# Altium project nexnclock_one_mainboard_rev_2_0.PrjPcb
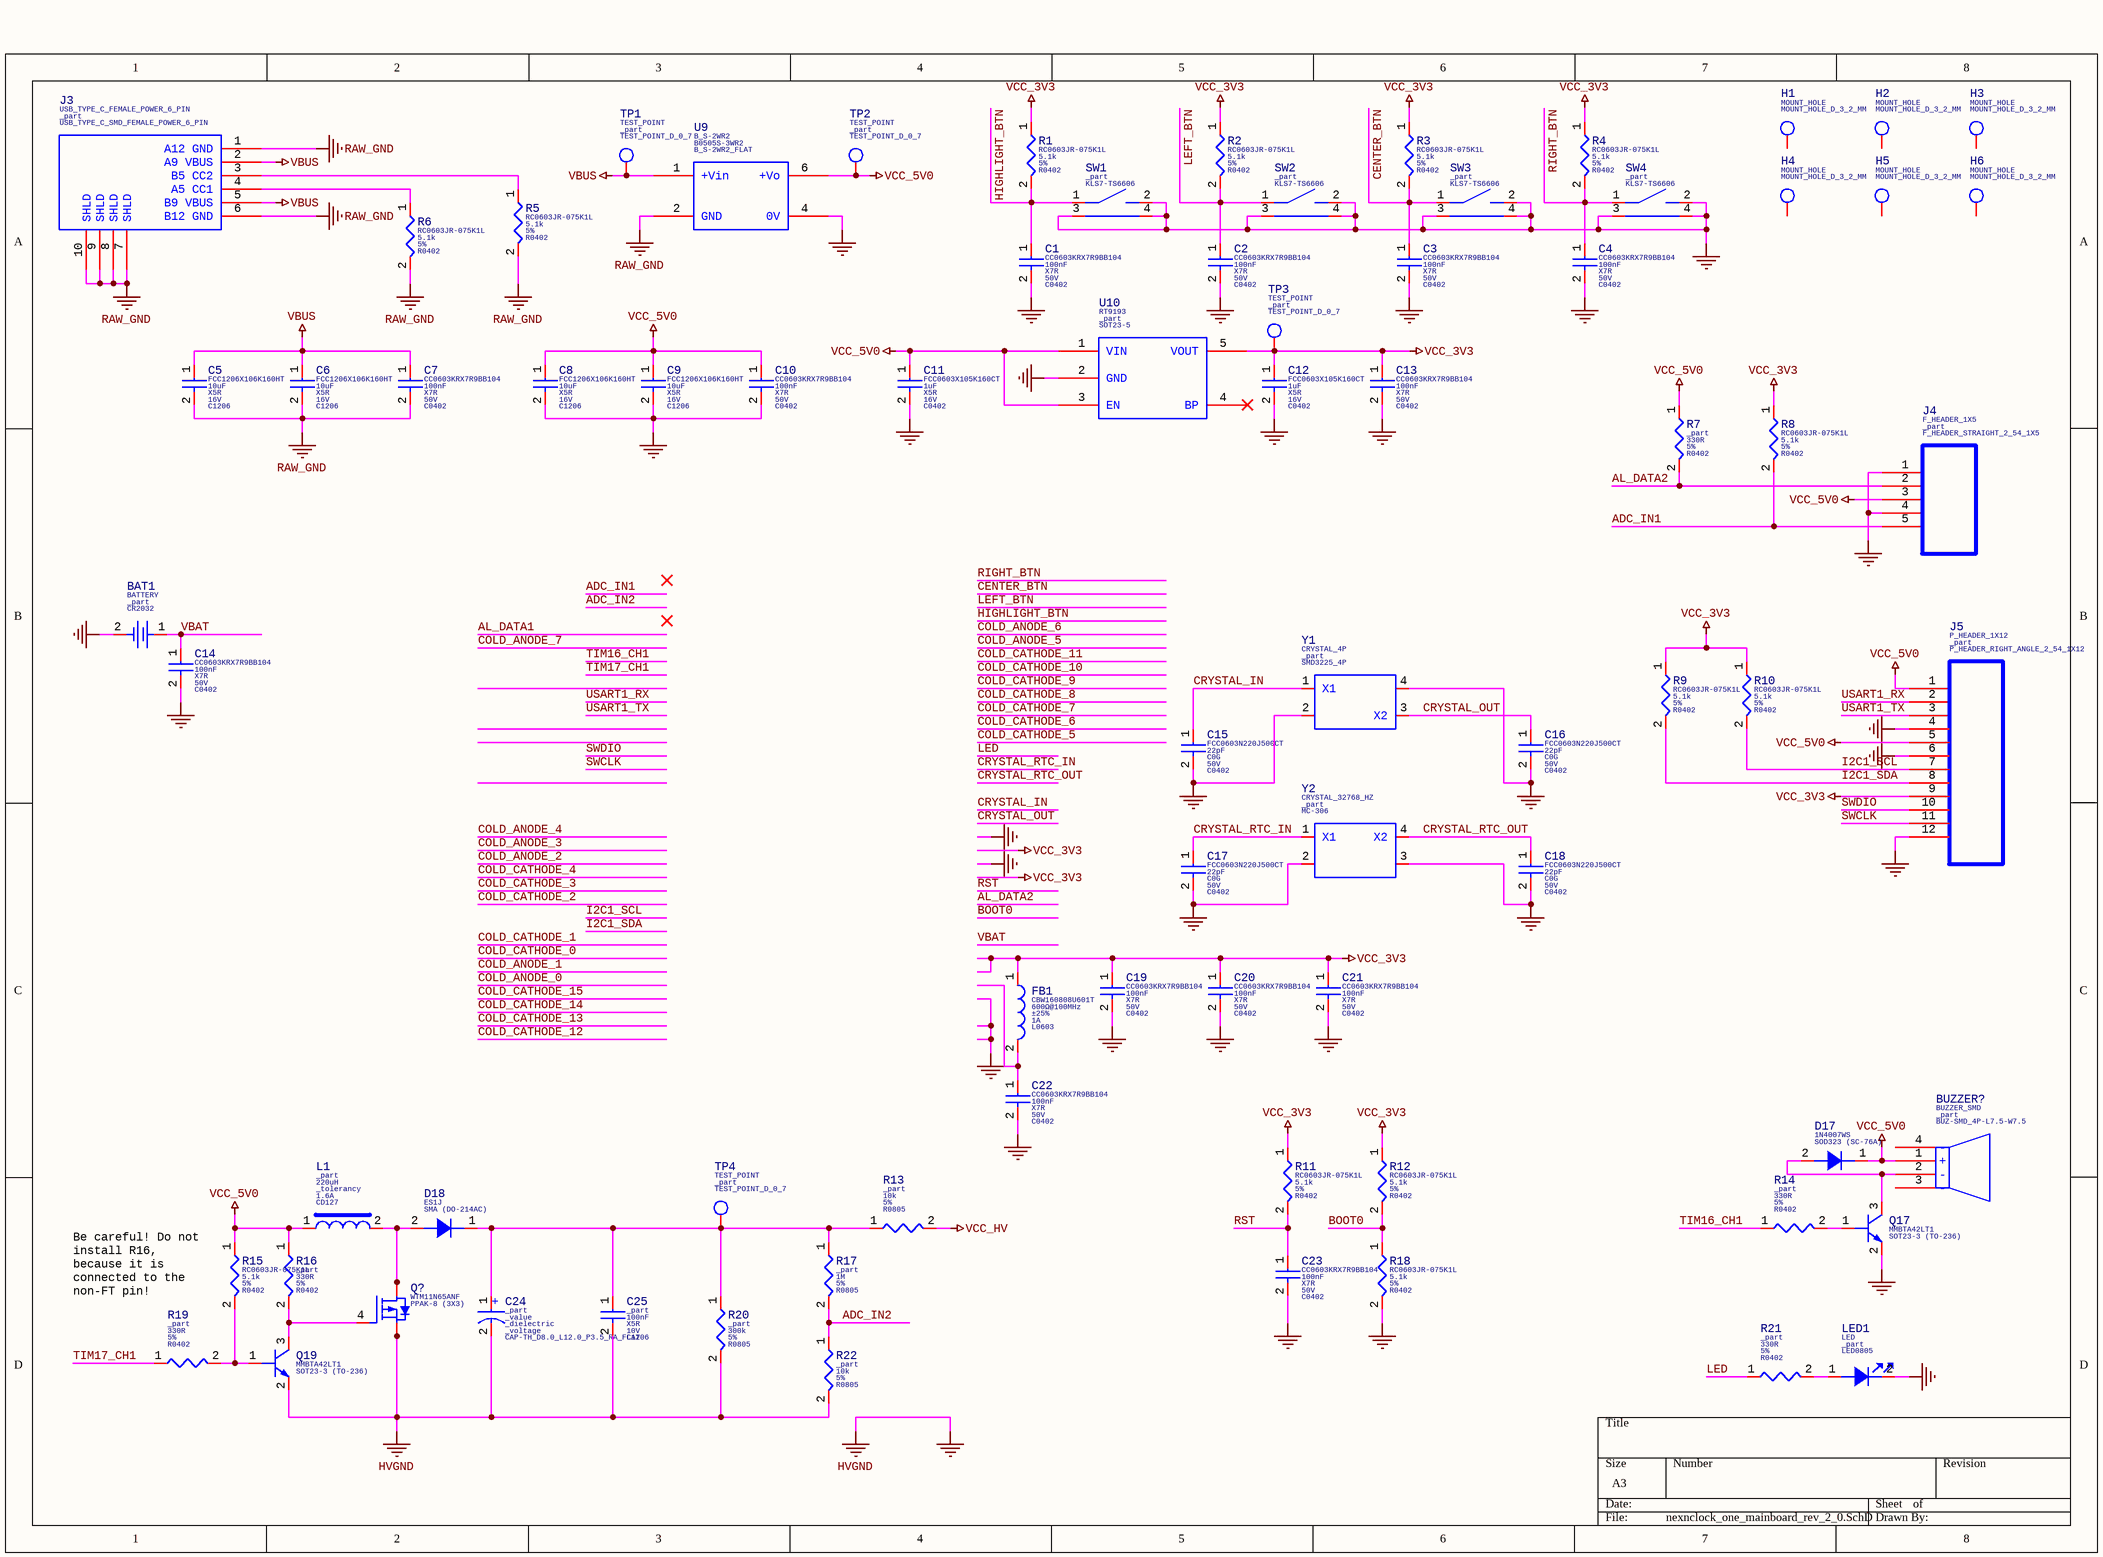
[diagram p0: nexnclock_one_mainboard_rev_2_0.SchDoc]
2 sheets, 119 parts. Net scope: global (net labels, ports and power ports of the same name join across sheets).
Board files: nexnclock_one_mainboard_rev_2_0.PcbDoc, multi_pcb.PcbDoc
Sheets:
  nexnclock_one_mainboard_rev_2_0.SchDoc
  hot_handle_part.SchDoc

## Sheet nexnclock_one_mainboard_rev_2_0.SchDoc
size A3; SheetNumber: 1; SheetTotal: 2

### Parts
BAT1  BATTERY  Part Reference: _part  [CR2032]
BUZZER?  BUZZER_SMD  Part Reference: _part  [BUZ-SMD_4P-L7.5-W7.5]
C1  value 100nF  Part Reference: CC0603KRX7R9BB104  Voltage: 50V  Dielectric: X7R  [C0402]  (hidden comment: CAP)
C2  value 100nF  Part Reference: CC0603KRX7R9BB104  Voltage: 50V  Dielectric: X7R  [C0402]  (hidden comment: CAP)
C3  value 100nF  Part Reference: CC0603KRX7R9BB104  Voltage: 50V  Dielectric: X7R  [C0402]  (hidden comment: CAP)
C4  value 100nF  Part Reference: CC0603KRX7R9BB104  Voltage: 50V  Dielectric: X7R  [C0402]  (hidden comment: CAP)
C5  value 10uF  Part Reference: FCC1206X106K160HT  Voltage: 16V  Dielectric: X5R  [C1206]  (hidden comment: CAP)
C6  value 10uF  Part Reference: FCC1206X106K160HT  Voltage: 16V  Dielectric: X5R  [C1206]  (hidden comment: CAP)
C7  value 100nF  Part Reference: CC0603KRX7R9BB104  Voltage: 50V  Dielectric: X7R  [C0402]  (hidden comment: CAP)
C8  value 10uF  Part Reference: FCC1206X106K160HT  Voltage: 16V  Dielectric: X5R  [C1206]  (hidden comment: CAP)
C9  value 10uF  Part Reference: FCC1206X106K160HT  Voltage: 16V  Dielectric: X5R  [C1206]  (hidden comment: CAP)
C10  value 100nF  Part Reference: CC0603KRX7R9BB104  Voltage: 50V  Dielectric: X7R  [C0402]  (hidden comment: CAP)
C11  value 1uF  Part Reference: FCC0603X105K160CT  Voltage: 16V  Dielectric: X5R  [C0402]  (hidden comment: CAP)
C12  value 1uF  Part Reference: FCC0603X105K160CT  Voltage: 16V  Dielectric: X5R  [C0402]  (hidden comment: CAP)
C13  value 100nF  Part Reference: CC0603KRX7R9BB104  Voltage: 50V  Dielectric: X7R  [C0402]  (hidden comment: CAP)
C14  value 100nF  Part Reference: CC0603KRX7R9BB104  Voltage: 50V  Dielectric: X7R  [C0402]  (hidden comment: CAP)
C15  value 22pF  Part Reference: FCC0603N220J500CT  Voltage: 50V  Dielectric: C0G  [C0402]  (hidden comment: CAP)
C16  value 22pF  Part Reference: FCC0603N220J500CT  Voltage: 50V  Dielectric: C0G  [C0402]  (hidden comment: CAP)
C17  value 22pF  Part Reference: FCC0603N220J500CT  Voltage: 50V  Dielectric: C0G  [C0402]  (hidden comment: CAP)
C18  value 22pF  Part Reference: FCC0603N220J500CT  Voltage: 50V  Dielectric: C0G  [C0402]  (hidden comment: CAP)
C19  value 100nF  Part Reference: CC0603KRX7R9BB104  Voltage: 50V  Dielectric: X7R  [C0402]  (hidden comment: CAP)
C20  value 100nF  Part Reference: CC0603KRX7R9BB104  Voltage: 50V  Dielectric: X7R  [C0402]  (hidden comment: CAP)
C21  value 100nF  Part Reference: CC0603KRX7R9BB104  Voltage: 50V  Dielectric: X7R  [C0402]  (hidden comment: CAP)
C22  value 100nF  Part Reference: CC0603KRX7R9BB104  Voltage: 50V  Dielectric: X7R  [C0402]  (hidden comment: CAP)
C23  value 100nF  Part Reference: CC0603KRX7R9BB104  Voltage: 50V  Dielectric: X7R  [C0402]  (hidden comment: CAP)
C24  value _value  Part Reference: _part  Voltage: _voltage  Dielectric: _dielectric  [CAP-TH_D8.0_L12.0_P3.5_RA_FLAT]  (hidden comment: CAP_POLAR)
C25  value 100nF  Part Reference: _part  Voltage: 10V  Dielectric: X5R  [C1206]  (hidden comment: CAP)
D17  Part Reference: 1N4007WS  [SOD323 (SC-76A)]  (hidden comment: DIODE)
D18  Part Reference: ES1J  [SMA (DO-214AC)]  (hidden comment: DIODE)
FB1  value 600Ω@100MHz  Part Reference: CBW160808U601T  Current: 1A  Tolerancy: ±25%  [L0603]  (hidden comment: BEAD)
H1  MOUNT_HOLE  [MOUNT_HOLE_D_3_2_MM]  (no BOM)
H2  MOUNT_HOLE  [MOUNT_HOLE_D_3_2_MM]  (no BOM)
H3  MOUNT_HOLE  [MOUNT_HOLE_D_3_2_MM]  (no BOM)
H4  MOUNT_HOLE  [MOUNT_HOLE_D_3_2_MM]  (no BOM)
H5  MOUNT_HOLE  [MOUNT_HOLE_D_3_2_MM]  (no BOM)
H6  MOUNT_HOLE  [MOUNT_HOLE_D_3_2_MM]  (no BOM)
J3  USB_TYPE_C_FEMALE_POWER_6_PIN  Part Reference: _part  [USB_TYPE_C_SMD_FEMALE_POWER_6_PIN]
J4  F_HEADER_1X5  Part Reference: _part  [F_HEADER_STRAIGHT_2_54_1X5]
J5  P_HEADER_1X12  Part Reference: _part  [P_HEADER_RIGHT_ANGLE_2_54_1X12]
L1  value 220uH  Part Reference: _part  Current: 1.6A  Tolerancy: _tolerancy  [CD127]  (hidden comment: POWER_INDUCTOR)
LED1  LED  Part Reference: _part  [LED0805]
Q17  Part Reference: MMBTA42LT1  [SOT23-3 (TO-236)]  (hidden comment: NPN)
Q19  Part Reference: MMBTA42LT1  [SOT23-3 (TO-236)]  (hidden comment: NPN)
Q?  Part Reference: WTM11N65ANF  [PPAK-8 (3X3)]  (hidden comment: MOSFET P POWER)
R1  value 5.1k  Tolerancy: 5%  Part Reference: RC0603JR-075K1L  [R0402]  (hidden comment: RESISTOR)
R2  value 5.1k  Tolerancy: 5%  Part Reference: RC0603JR-075K1L  [R0402]  (hidden comment: RESISTOR)
R3  value 5.1k  Tolerancy: 5%  Part Reference: RC0603JR-075K1L  [R0402]  (hidden comment: RESISTOR)
R4  value 5.1k  Tolerancy: 5%  Part Reference: RC0603JR-075K1L  [R0402]  (hidden comment: RESISTOR)
R5  value 5.1k  Tolerancy: 5%  Part Reference: RC0603JR-075K1L  [R0402]  (hidden comment: RESISTOR)
R6  value 5.1k  Tolerancy: 5%  Part Reference: RC0603JR-075K1L  [R0402]  (hidden comment: RESISTOR)
R7  value 330R  Tolerancy: 5%  Part Reference: _part  [R0402]  (hidden comment: RESISTOR)
R8  value 5.1k  Tolerancy: 5%  Part Reference: RC0603JR-075K1L  [R0402]  (hidden comment: RESISTOR)
R9  value 5.1k  Tolerancy: 5%  Part Reference: RC0603JR-075K1L  [R0402]  (hidden comment: RESISTOR)
R10  value 5.1k  Tolerancy: 5%  Part Reference: RC0603JR-075K1L  [R0402]  (hidden comment: RESISTOR)
R11  value 5.1k  Tolerancy: 5%  Part Reference: RC0603JR-075K1L  [R0402]  (hidden comment: RESISTOR)
R12  value 5.1k  Tolerancy: 5%  Part Reference: RC0603JR-075K1L  [R0402]  (hidden comment: RESISTOR)
R13  value 10k  Tolerancy: 5%  Part Reference: _part  [R0805]  (hidden comment: RESISTOR)
R14  value 330R  Tolerancy: 5%  Part Reference: _part  [R0402]  (hidden comment: RESISTOR)
R15  value 5.1k  Tolerancy: 5%  Part Reference: RC0603JR-075K1L  [R0402]  (hidden comment: RESISTOR)
R16  value 330R  Tolerancy: 5%  Part Reference: _part  [R0402]  (hidden comment: RESISTOR)
R17  value 1M  Tolerancy: 5%  Part Reference: _part  [R0805]  (hidden comment: RESISTOR)
R18  value 5.1k  Tolerancy: 5%  Part Reference: RC0603JR-075K1L  [R0402]  (hidden comment: RESISTOR)
R19  value 330R  Tolerancy: 5%  Part Reference: _part  [R0402]  (hidden comment: RESISTOR)
R20  value 300k  Tolerancy: 5%  Part Reference: _part  [R0805]  (hidden comment: RESISTOR)
R21  value 330R  Tolerancy: 5%  Part Reference: _part  [R0402]  (hidden comment: RESISTOR)
R22  value 10k  Tolerancy: 5%  Part Reference: _part  [R0805]  (hidden comment: RESISTOR)
SW1  Part Reference: _part  [KLS7-TS6606]  (hidden comment: TACTILE_SWITCH)
SW2  Part Reference: _part  [KLS7-TS6606]  (hidden comment: TACTILE_SWITCH)
SW3  Part Reference: _part  [KLS7-TS6606]  (hidden comment: TACTILE_SWITCH)
SW4  Part Reference: _part  [KLS7-TS6606]  (hidden comment: TACTILE_SWITCH)
TP1  TEST_POINT  Part Reference: _part  [TEST_POINT_D_0_7]  (no BOM)
TP2  TEST_POINT  Part Reference: _part  [TEST_POINT_D_0_7]  (no BOM)
TP3  TEST_POINT  Part Reference: _part  [TEST_POINT_D_0_7]
TP4  TEST_POINT  Part Reference: _part  [TEST_POINT_D_0_7]
U9  B_S-2WR2  Part Reference: B0505S-3WR2  [B_S-2WR2_FLAT]
U10  RT9193  Part Reference: _part  [SOT23-5]
Y1  CRYSTAL_4P  Part Reference: _part  [SMD3225_4P]
Y2  CRYSTAL_32768_HZ  Part Reference: _part  [MC-306]

### Nets
GND: BAT1.2 C1.2 C2.2 C3.2 C4.2 C8.2 C9.2 C10.2 C11.2 C12.2 C13.2 C14.2 C15.2 C16.2 C17.2 C18.2 C19.2 C20.2 C21.2 C22.2 C23.2 C24.2 C25.2 J4.1 J4.4 J5.4 J5.6 J5.12 LED1.2(A) Q17.2(EMITTER) Q19.2(EMITTER) Q?.1(S) Q?.2(S) Q?.3(S) R18.2 R20.2 R22.2 SW1.2 SW1.3 SW1.4 SW2.2 SW2.3 SW2.4 SW3.2 SW3.3 SW3.4 SW4.2 SW4.3 SW4.4 U9.4(0V) U10.2(GND) Y1.2 Y1.4 Y2.2 Y2.3  [also labelled HVGND]
RAW_GND: C5.2 C6.2 C7.2 J3.1(A12_GND) J3.6(B12_GND) J3.7(SHLD) J3.8(SHLD) J3.9(SHLD) J3.10(SHLD) R5.2 R6.2 U9.2(GND)
VBUS: C5.1 C6.1 C7.1 J3.2(A9_VBUS) J3.5(B9_VBUS) TP1.1 U9.1(+Vin)
VCC_3V3: C12.1 C13.1 C19.1 C20.1 C21.1 FB1.1 J5.9 R1.1 R2.1 R3.1 R4.1 R8.1 R9.1 R10.1 R11.1 R12.1 TP3.1 U10.5(VOUT)
VCC_5V0: BUZZER?.1(+) C8.1 C9.1 C10.1 C11.1 D17.1(C) J4.3 J5.1 J5.5 L1.1 R7.1 R15.1 R16.1 TP2.1 U9.6(+Vo) U10.1(VIN) U10.3(EN)
VCC_HV: R13.2
ADC_IN1: J4.5 R8.2
ADC_IN2: R17.2 R22.1
AL_DATA2: J4.2 R7.2
BOOT0: R12.2 R18.1
CENTER_BTN: C3.1 R3.2 SW3.1
CRYSTAL_IN: C15.1 Y1.1(X1)
CRYSTAL_OUT: C16.1 Y1.3(X2)
CRYSTAL_RTC_IN: C17.1 Y2.1(X1)
CRYSTAL_RTC_OUT: C18.1 Y2.4(X2)
HIGHLIGHT_BTN: C1.1 R1.2 SW1.1
I2C1_SCL: J5.7 R10.2
I2C1_SDA: J5.8 R9.2
LED: R21.1
LEFT_BTN: C2.1 R2.2 SW2.1
RIGHT_BTN: C4.1 R4.2 SW4.1
RST: C23.1 R11.2
SWCLK: J5.11
SWDIO: J5.10
TIM16_CH1: R14.1
TIM17_CH1: R19.1
USART1_RX: J5.2
USART1_TX: J5.3
VBAT: BAT1.1 C14.1
NetBUZZER?_2: BUZZER?.2(-) D17.2(A) Q17.3(COLLECTOR)
NetC22_1: C22.1 FB1.2
NetC24_1: C24.1 C25.1 D18.1(C) R13.1 R17.1 R20.1 TP4.1
NetD18_2: D18.2(A) L1.2 Q?.5(DRAIN) Q?.6(DRAIN) Q?.7(DRAIN) Q?.8(DRAIN)
NetJ3_3: J3.3(B5_CC2) R5.1
NetJ3_4: J3.4(A5_CC1) R6.1
NetLED1_1: LED1.1(C) R21.2
NetQ17_1: Q17.1(BASE) R14.2
NetQ19_1: Q19.1(BASE) R15.2 R19.2
NetQ19_3: Q19.3(COLLECTOR) Q?.4(GATE) R16.2

Not connected (* = marked no-connect by the designer): BUZZER? 3(-) 4(-); H1 1; H2 1; H3 1; H4 1; H5 1; H6 1; U10 4(BP)*

### Notes on the sheet
- (near R15) Be careful! Do not install R16, because it is connected to the non-FT pin!
- (in symbol CAP_POLAR) +

### Library data of the parts
BAT1 = BATTERY: Manufacturer: _manufacturer; Procurement Type: DNP; PCB Footprint: CR2032
BUZZER? = BUZZER_SMD: Manufacturer: _manufacturer; PCB Footprint: BUZ-SMD_4P-L7.5-W7.5
C1-C4 C7 C10 C13 C14 C19-C23 = CAP: Manufacturer: YAGEO; PCB Footprint: C0402
C5 C6 C8 C9 C15-C18 C25 = CAP: Manufacturer: _manufacturer
  C5 C6 C8 C9 C25: PCB Footprint: C1206
  C15-C18: PCB Footprint: C0402
C11 C12 = CAP: Manufacturer: FOJAN; PCB Footprint: C0402
C24 = CAP_POLAR: Manufacturer: _manufacturer; PCB Footprint: CAP-TH_D8.0_L12.0_P3.5_RA_FLAT
D17 = DIODE: Manufacturer: _manufacturer; PCB Footprint: SOD323 (SC-76A)
D18 = DIODE: Manufacturer: _manufacturer; Procurement Type: DNP; PCB Footprint: SMA (DO-214AC)
FB1 = BEAD: Manufacturer: FH (Guangdong Fenghua Advanced Tech); PCB Footprint: L0603
H1-H6 = MOUNT_HOLE: Manufacturer: _manufacturer; Procurement Type: DNP; PCB Footprint: MOUNT_HOLE_D_3_2_MM
J3 = USB_TYPE_C_FEMALE_POWER_6_PIN: Manufacturer: _manufacturer; PCB Footprint: USB_TYPE_C_SMD_FEMALE_POWER_6_PIN
J4 = F_HEADER_1X5: Manufacturer: _manufacturer; PCB Footprint: F_HEADER_STRAIGHT_2_54_1X5
J5 = P_HEADER_1X12: Manufacturer: _manufacturer; PCB Footprint: P_HEADER_RIGHT_ANGLE_2_54_1X12
L1 = POWER_INDUCTOR: Manufacturer: _manufacturer; PCB Footprint: CD127
LED1 = LED: Manufacturer: _manufacturer; PCB Footprint: LED0805
Q17 Q19 = NPN: Manufacturer: _manufacturer; PCB Footprint: SOT23-3 (TO-236)
Q? = MOSFET P POWER: Manufacturer: _manufacturer; PCB Footprint: PPAK-8 (3X3)
R1-R6 R8-R12 R15 R18 = RESISTOR: Manufacturer: YAGEO; PCB Footprint: R0402
R7 R13 R14 R16 R17 R19-R22 = RESISTOR: Manufacturer: _manufacturer
  R7 R14 R16 R19 R21: PCB Footprint: R0402
  R13 R17 R20 R22: PCB Footprint: R0805
SW1-SW4 = TACTILE_SWITCH: Manufacturer: _manufacturer; PCB Footprint: KLS7-TS6606
TP1-TP4 = TEST_POINT: Manufacturer: _manufacturer; PCB Footprint: TEST_POINT_D_0_7
U9 = B_S-2WR2: Manufacturer: EVISUN; PCB Footprint: B_S-2WR2_FLAT
U10 = RT9193: Manufacturer: _manufacturer; PCB Footprint: SOT23-5
Y1 = CRYSTAL_4P: Manufacturer: _manufacturer; PCB Footprint: SMD3225_4P
Y2 = CRYSTAL_32768_HZ: Manufacturer: _manufacturer; PCB Footprint: MC-306

## Sheet hot_handle_part.SchDoc
size A3; SheetNumber: 2; SheetTotal: 2
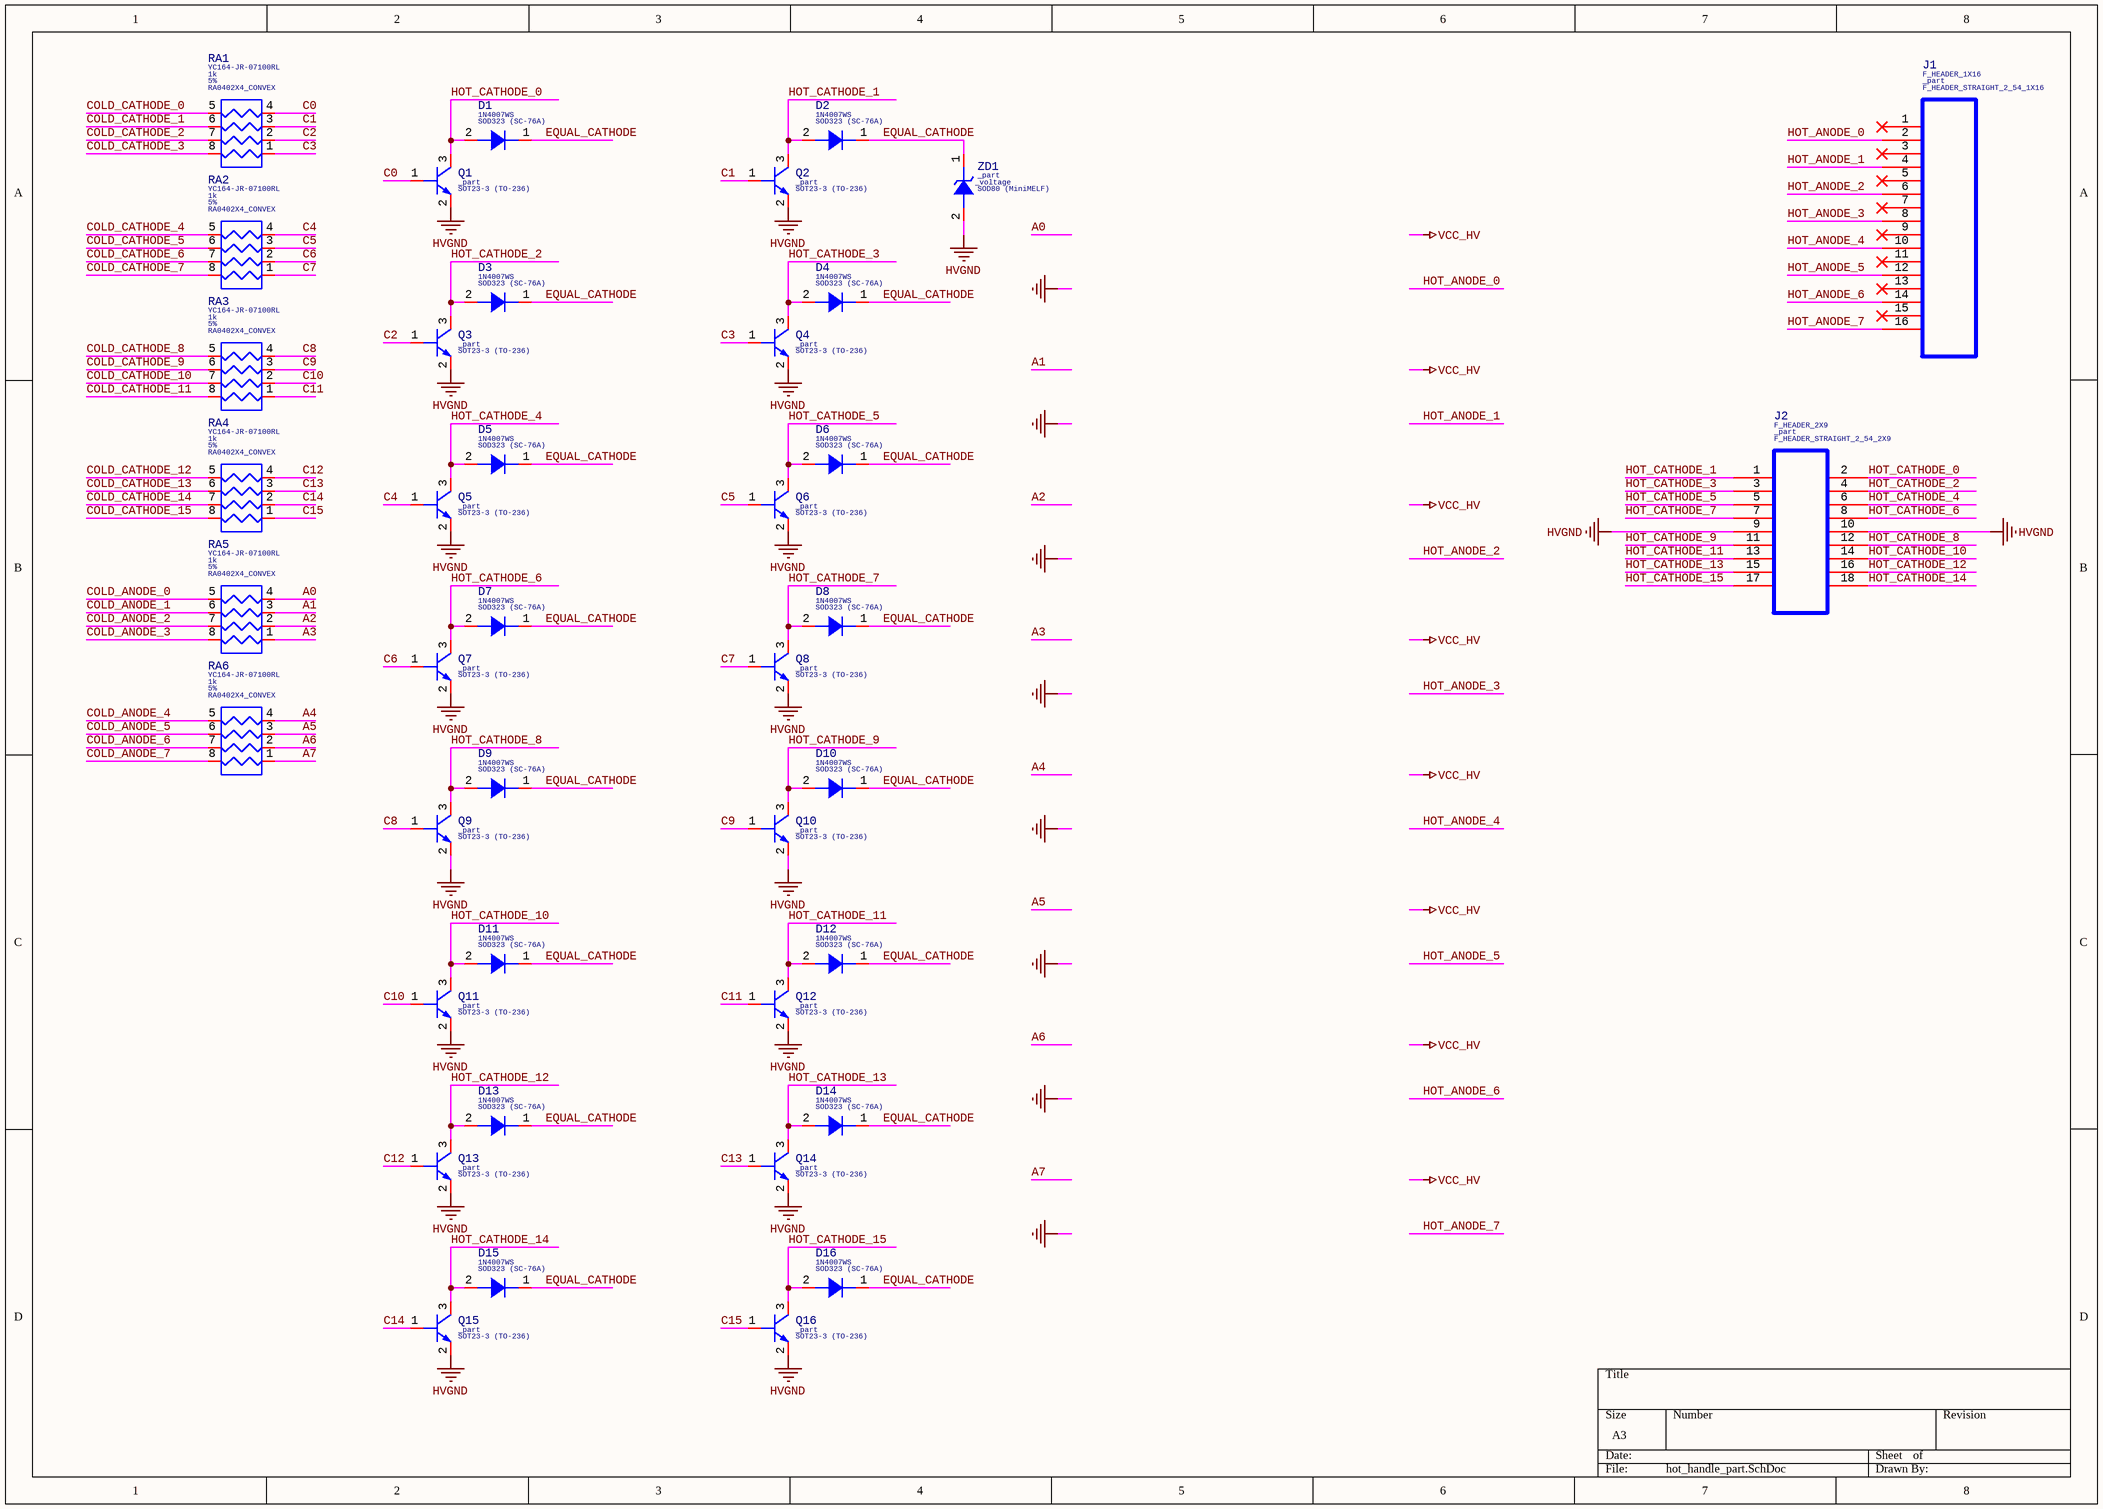
[diagram p1: hot_handle_part.SchDoc]

### Parts
D1  Part Reference: 1N4007WS  [SOD323 (SC-76A)]  (hidden comment: DIODE)
D2  Part Reference: 1N4007WS  [SOD323 (SC-76A)]  (hidden comment: DIODE)
D3  Part Reference: 1N4007WS  [SOD323 (SC-76A)]  (hidden comment: DIODE)
D4  Part Reference: 1N4007WS  [SOD323 (SC-76A)]  (hidden comment: DIODE)
D5  Part Reference: 1N4007WS  [SOD323 (SC-76A)]  (hidden comment: DIODE)
D6  Part Reference: 1N4007WS  [SOD323 (SC-76A)]  (hidden comment: DIODE)
D7  Part Reference: 1N4007WS  [SOD323 (SC-76A)]  (hidden comment: DIODE)
D8  Part Reference: 1N4007WS  [SOD323 (SC-76A)]  (hidden comment: DIODE)
D9  Part Reference: 1N4007WS  [SOD323 (SC-76A)]  (hidden comment: DIODE)
D10  Part Reference: 1N4007WS  [SOD323 (SC-76A)]  (hidden comment: DIODE)
D11  Part Reference: 1N4007WS  [SOD323 (SC-76A)]  (hidden comment: DIODE)
D12  Part Reference: 1N4007WS  [SOD323 (SC-76A)]  (hidden comment: DIODE)
D13  Part Reference: 1N4007WS  [SOD323 (SC-76A)]  (hidden comment: DIODE)
D14  Part Reference: 1N4007WS  [SOD323 (SC-76A)]  (hidden comment: DIODE)
D15  Part Reference: 1N4007WS  [SOD323 (SC-76A)]  (hidden comment: DIODE)
D16  Part Reference: 1N4007WS  [SOD323 (SC-76A)]  (hidden comment: DIODE)
J1  F_HEADER_1X16  Part Reference: _part  [F_HEADER_STRAIGHT_2_54_1X16]
J2  F_HEADER_2X9  Part Reference: _part  [F_HEADER_STRAIGHT_2_54_2X9]
Q1  Part Reference: _part  [SOT23-3 (TO-236)]  (hidden comment: BJT NPN)
Q2  Part Reference: _part  [SOT23-3 (TO-236)]  (hidden comment: BJT NPN)
Q3  Part Reference: _part  [SOT23-3 (TO-236)]  (hidden comment: BJT NPN)
Q4  Part Reference: _part  [SOT23-3 (TO-236)]  (hidden comment: BJT NPN)
Q5  Part Reference: _part  [SOT23-3 (TO-236)]  (hidden comment: BJT NPN)
Q6  Part Reference: _part  [SOT23-3 (TO-236)]  (hidden comment: BJT NPN)
Q7  Part Reference: _part  [SOT23-3 (TO-236)]  (hidden comment: BJT NPN)
Q8  Part Reference: _part  [SOT23-3 (TO-236)]  (hidden comment: BJT NPN)
Q9  Part Reference: _part  [SOT23-3 (TO-236)]  (hidden comment: BJT NPN)
Q10  Part Reference: _part  [SOT23-3 (TO-236)]  (hidden comment: BJT NPN)
Q11  Part Reference: _part  [SOT23-3 (TO-236)]  (hidden comment: BJT NPN)
Q12  Part Reference: _part  [SOT23-3 (TO-236)]  (hidden comment: BJT NPN)
Q13  Part Reference: _part  [SOT23-3 (TO-236)]  (hidden comment: BJT NPN)
Q14  Part Reference: _part  [SOT23-3 (TO-236)]  (hidden comment: BJT NPN)
Q15  Part Reference: _part  [SOT23-3 (TO-236)]  (hidden comment: BJT NPN)
Q16  Part Reference: _part  [SOT23-3 (TO-236)]  (hidden comment: BJT NPN)
RA1  value 1k  Tolerancy: 5%  Part Reference: YC164-JR-07100RL  [RA0402X4_CONVEX]  (hidden comment: RESISTOR_ARRAY_X4)
RA2  value 1k  Tolerancy: 5%  Part Reference: YC164-JR-07100RL  [RA0402X4_CONVEX]  (hidden comment: RESISTOR_ARRAY_X4)
RA3  value 1k  Tolerancy: 5%  Part Reference: YC164-JR-07100RL  [RA0402X4_CONVEX]  (hidden comment: RESISTOR_ARRAY_X4)
RA4  value 1k  Tolerancy: 5%  Part Reference: YC164-JR-07100RL  [RA0402X4_CONVEX]  (hidden comment: RESISTOR_ARRAY_X4)
RA5  value 1k  Tolerancy: 5%  Part Reference: YC164-JR-07100RL  [RA0402X4_CONVEX]  (hidden comment: RESISTOR_ARRAY_X4)
RA6  value 1k  Tolerancy: 5%  Part Reference: YC164-JR-07100RL  [RA0402X4_CONVEX]  (hidden comment: RESISTOR_ARRAY_X4)
ZD1  Voltage: _voltage  Part Reference: _part  [SOD80 (MiniMELF)]  (hidden comment: DIODE_ZENER)

### Nets
GND: J2.9 J2.10 Q1.2(EMITTER) Q2.2(EMITTER) Q3.2(EMITTER) Q4.2(EMITTER) Q5.2(EMITTER) Q6.2(EMITTER) Q7.2(EMITTER) Q8.2(EMITTER) Q9.2(EMITTER) Q10.2(EMITTER) Q11.2(EMITTER) Q12.2(EMITTER) Q13.2(EMITTER) Q14.2(EMITTER) Q15.2(EMITTER) Q16.2(EMITTER) ZD1.2(A)  [also labelled HVGND]
A0: RA5.4
A1: RA5.3
A2: RA5.2
A3: RA5.1
A4: RA6.4
A5: RA6.3
A6: RA6.2
A7: RA6.1
C0: Q1.1(BASE) RA1.4
C1: Q2.1(BASE) RA1.3
C2: Q3.1(BASE) RA1.2
C3: Q4.1(BASE) RA1.1
C4: Q5.1(BASE) RA2.4
C5: Q6.1(BASE) RA2.3
C6: Q7.1(BASE) RA2.2
C7: Q8.1(BASE) RA2.1
C8: Q9.1(BASE) RA3.4
C9: Q10.1(BASE) RA3.3
C10: Q11.1(BASE) RA3.2
C11: Q12.1(BASE) RA3.1
C12: Q13.1(BASE) RA4.4
C13: Q14.1(BASE) RA4.3
C14: Q15.1(BASE) RA4.2
C15: Q16.1(BASE) RA4.1
COLD_ANODE_0: RA5.5
COLD_ANODE_1: RA5.6
COLD_ANODE_2: RA5.7
COLD_ANODE_3: RA5.8
COLD_ANODE_4: RA6.5
COLD_ANODE_5: RA6.6
COLD_ANODE_6: RA6.7
COLD_ANODE_7: RA6.8
COLD_CATHODE_0: RA1.5
COLD_CATHODE_1: RA1.6
COLD_CATHODE_2: RA1.7
COLD_CATHODE_3: RA1.8
COLD_CATHODE_4: RA2.5
COLD_CATHODE_5: RA2.6
COLD_CATHODE_6: RA2.7
COLD_CATHODE_7: RA2.8
COLD_CATHODE_8: RA3.5
COLD_CATHODE_9: RA3.6
COLD_CATHODE_10: RA3.7
COLD_CATHODE_11: RA3.8
COLD_CATHODE_12: RA4.5
COLD_CATHODE_13: RA4.6
COLD_CATHODE_14: RA4.7
COLD_CATHODE_15: RA4.8
EQUAL_CATHODE: D1.1(C) D2.1(C) D3.1(C) D4.1(C) D5.1(C) D6.1(C) D7.1(C) D8.1(C) D9.1(C) D10.1(C) D11.1(C) D12.1(C) D13.1(C) D14.1(C) D15.1(C) D16.1(C) ZD1.1(C)
HOT_ANODE_0: J1.2
HOT_ANODE_1: J1.4
HOT_ANODE_2: J1.6
HOT_ANODE_3: J1.8
HOT_ANODE_4: J1.10
HOT_ANODE_5: J1.12
HOT_ANODE_6: J1.14
HOT_ANODE_7: J1.16
HOT_CATHODE_0: D1.2(A) J2.2 Q1.3(COLLECTOR)
HOT_CATHODE_1: D2.2(A) J2.1 Q2.3(COLLECTOR)
HOT_CATHODE_2: D3.2(A) J2.4 Q3.3(COLLECTOR)
HOT_CATHODE_3: D4.2(A) J2.3 Q4.3(COLLECTOR)
HOT_CATHODE_4: D5.2(A) J2.6 Q5.3(COLLECTOR)
HOT_CATHODE_5: D6.2(A) J2.5 Q6.3(COLLECTOR)
HOT_CATHODE_6: D7.2(A) J2.8 Q7.3(COLLECTOR)
HOT_CATHODE_7: D8.2(A) J2.7 Q8.3(COLLECTOR)
HOT_CATHODE_8: D9.2(A) J2.12 Q9.3(COLLECTOR)
HOT_CATHODE_9: D10.2(A) J2.11 Q10.3(COLLECTOR)
HOT_CATHODE_10: D11.2(A) J2.14 Q11.3(COLLECTOR)
HOT_CATHODE_11: D12.2(A) J2.13 Q12.3(COLLECTOR)
HOT_CATHODE_12: D13.2(A) J2.16 Q13.3(COLLECTOR)
HOT_CATHODE_13: D14.2(A) J2.15 Q14.3(COLLECTOR)
HOT_CATHODE_14: D15.2(A) J2.18 Q15.3(COLLECTOR)
HOT_CATHODE_15: D16.2(A) J2.17 Q16.3(COLLECTOR)

Not connected (* = marked no-connect by the designer): J1 1* 3* 5* 7* 9* 11* 13* 15*

### Library data of the parts
D1-D16 = DIODE: Manufacturer: _manufacturer; PCB Footprint: SOD323 (SC-76A)
J1 = F_HEADER_1X16: Manufacturer: _manufacturer; PCB Footprint: F_HEADER_STRAIGHT_2_54_1X16
J2 = F_HEADER_2X9: Manufacturer: _manufacturer; PCB Footprint: F_HEADER_STRAIGHT_2_54_2X9
Q1-Q16 = BJT NPN: Manufacturer: _manufacturer; PCB Footprint: SOT23-3 (TO-236)
RA1-RA6 = RESISTOR_ARRAY_X4: Manufacturer: YAGEO; PCB Footprint: RA0402X4_CONVEX
ZD1 = DIODE_ZENER: Manufacturer: _manufacturer; PCB Footprint: SOD80 (MiniMELF)

## Nets that join several sheets
GND: nexnclock_one_mainboard_rev_2_0 (55 pins), hot_handle_part (19 pins)